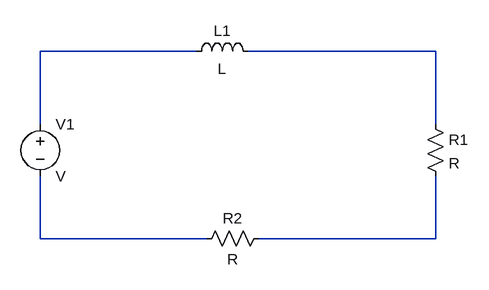
[diagram p0: schematic Draft1.asc]
Draft1.asc, the LTspice schematic file:
Version 4.1
SHEET 1 880 680
WIRE 320 32 80 32
WIRE 688 32 400 32
WIRE 80 144 80 32
WIRE 688 144 688 32
WIRE 80 320 80 224
WIRE 336 320 80 320
WIRE 688 320 688 224
WIRE 688 320 416 320
SYMBOL voltage 80 128 R0
SYMATTR InstName V1
SYMBOL ind 304 48 R270
WINDOW 0 32 56 VTop 2
WINDOW 3 5 56 VBottom 2
SYMATTR InstName L1
SYMBOL res 672 128 R0
SYMATTR InstName R1
SYMBOL res 432 304 R90
WINDOW 0 0 56 VBottom 2
WINDOW 3 32 56 VTop 2
SYMATTR InstName R2

The netlist it stands for:
* Draft1.asc
V1 N001 N003 V
L1 N001 N002 L
R1 N002 N004 R
R2 N004 N003 R
.backanno
.end